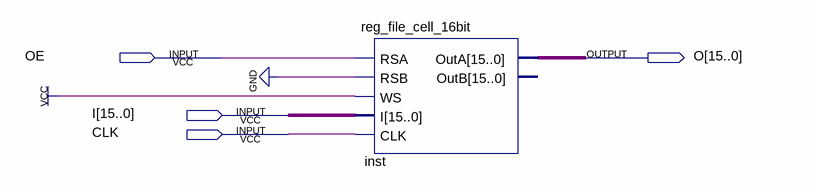
[diagram p0: schematic sheet]
// Quartus schematic reg_16.bdf as structural Verilog: 1 symbols, 4 pins
module reg_16 (
  input  OE,
  input  [15:0] I,
  input  CLK,
  output [15:0] O
);

  reg_file_cell_16bit inst (.RSA(OE), .RSB(1'b0), .WS(1'b1), .I(I), .CLK(CLK), .OutA(O));  // open: OutB
endmodule
